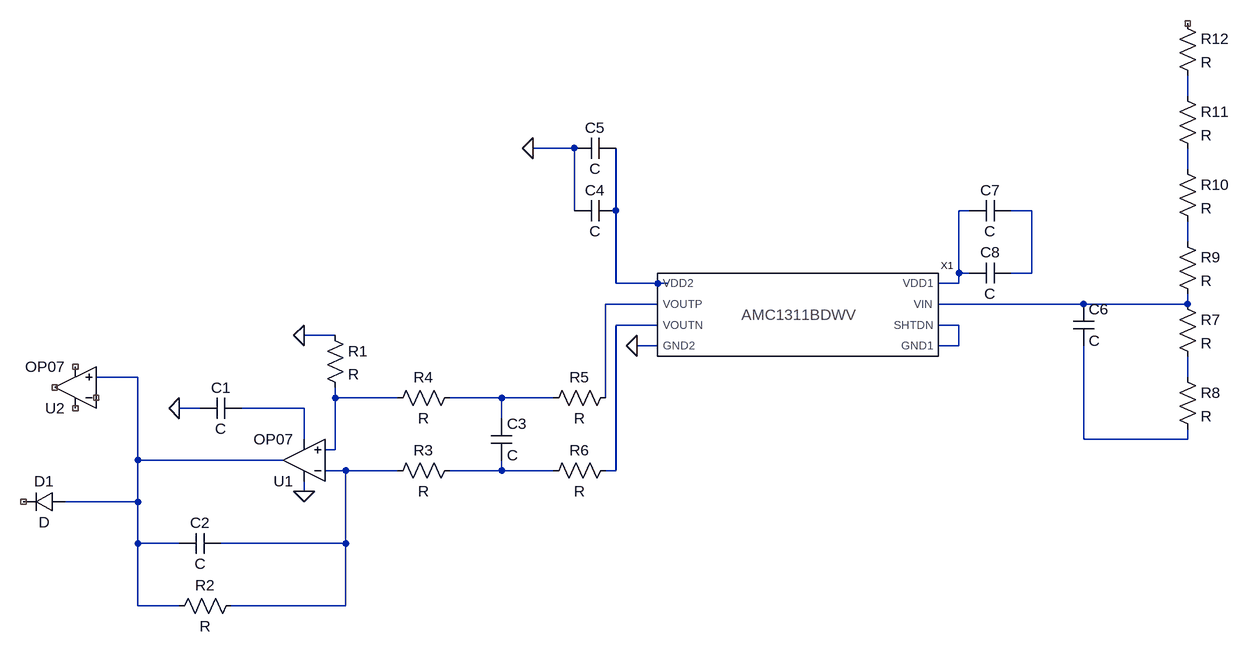
[diagram p0: schematic Bennet_LTSpice.asc]
Bennet_LTSpice.asc, the LTspice schematic file:
Version 4.1
SHEET 1 1588 680
WIRE 1488 -416 1488 -448
WIRE 544 -336 480 -336
WIRE 1488 -304 1488 -336
WIRE 544 -240 544 -336
WIRE 608 -240 608 -336
WIRE 1152 -240 1136 -240
WIRE 1248 -240 1216 -240
WIRE 1488 -192 1488 -224
WIRE 1136 -144 1136 -240
WIRE 1152 -144 1136 -144
WIRE 1248 -144 1248 -240
WIRE 1248 -144 1216 -144
WIRE 608 -128 608 -240
WIRE 672 -128 608 -128
WIRE 688 -128 672 -128
WIRE 1136 -128 1136 -144
WIRE 1136 -128 1104 -128
WIRE 672 -96 592 -96
WIRE 1328 -96 1104 -96
WIRE 1488 -96 1488 -112
WIRE 1488 -96 1328 -96
WIRE 672 -64 608 -64
WIRE 1136 -64 1104 -64
WIRE 176 -48 128 -48
WIRE 672 -32 640 -32
WIRE 1136 -32 1136 -64
WIRE 1136 -32 1104 -32
WIRE -128 16 -192 16
WIRE 1488 16 1488 -16
WIRE 176 48 176 32
WIRE 272 48 176 48
WIRE 432 48 352 48
WIRE 512 48 432 48
WIRE 592 48 592 -96
WIRE -32 64 -64 64
WIRE 128 64 32 64
WIRE 432 80 432 48
WIRE 128 112 128 64
WIRE 1328 112 1328 -32
WIRE 1488 112 1488 96
WIRE 1488 112 1328 112
WIRE 176 128 176 48
WIRE 176 128 160 128
WIRE -128 144 -128 16
WIRE 96 144 -128 144
WIRE 192 160 160 160
WIRE 272 160 192 160
WIRE 432 160 432 144
WIRE 432 160 352 160
WIRE 512 160 432 160
WIRE 608 160 608 -64
WIRE 608 160 592 160
WIRE 128 192 128 176
WIRE -128 208 -128 144
WIRE -128 208 -240 208
WIRE -128 272 -128 208
WIRE -64 272 -128 272
WIRE 192 272 192 160
WIRE 192 272 0 272
WIRE -128 368 -128 272
WIRE -64 368 -128 368
WIRE 192 368 192 272
WIRE 192 368 16 368
FLAG 128 -48 0
FLAG -64 64 0
FLAG 128 192 0
FLAG 480 -336 0
FLAG 640 -32 0
SYMBOL OpAmps\\OP07 128 208 R180
SYMATTR InstName U1
SYMBOL cap 32 48 R90
WINDOW 0 0 32 VBottom 2
WINDOW 3 32 32 VTop 2
SYMATTR InstName C1
SYMBOL OpAmps\\OP07 -224 96 R180
SYMATTR InstName U2
SYMBOL res 160 -64 R0
SYMATTR InstName R1
SYMBOL cap 0 256 R90
WINDOW 0 0 32 VBottom 2
WINDOW 3 32 32 VTop 2
SYMATTR InstName C2
SYMBOL res 32 352 R90
WINDOW 0 0 56 VBottom 2
WINDOW 3 32 56 VTop 2
SYMATTR InstName R2
SYMBOL res 368 144 R90
WINDOW 0 0 56 VBottom 2
WINDOW 3 32 56 VTop 2
SYMATTR InstName R3
SYMBOL diode -240 192 R90
WINDOW 0 0 32 VBottom 2
WINDOW 3 32 32 VTop 2
SYMATTR InstName D1
SYMBOL res 368 32 R90
WINDOW 0 0 56 VBottom 2
WINDOW 3 32 56 VTop 2
SYMATTR InstName R4
SYMBOL cap 416 80 R0
SYMATTR InstName C3
SYMBOL res 608 32 R90
WINDOW 0 0 56 VBottom 2
WINDOW 3 32 56 VTop 2
SYMATTR InstName R5
SYMBOL res 608 144 R90
WINDOW 0 0 56 VBottom 2
WINDOW 3 32 56 VTop 2
SYMATTR InstName R6
SYMBOL cap 608 -256 R90
WINDOW 0 0 32 VBottom 2
WINDOW 3 32 32 VTop 2
SYMATTR InstName C4
SYMBOL cap 608 -352 R90
WINDOW 0 0 32 VBottom 2
WINDOW 3 32 32 VTop 2
SYMATTR InstName C5
SYMBOL cap 1312 -96 R0
SYMATTR InstName C6
SYMBOL res 1472 -112 R0
SYMATTR InstName R7
SYMBOL res 1472 0 R0
SYMATTR InstName R8
SYMBOL res 1472 -208 R0
SYMATTR InstName R9
SYMBOL res 1472 -320 R0
SYMATTR InstName R10
SYMBOL res 1472 -432 R0
SYMATTR InstName R11
SYMBOL res 1472 -544 R0
SYMATTR InstName R12
SYMBOL AMC1311BDWV_CUSTOM 896 -80 R0
SYMATTR InstName X1
SYMBOL cap 1216 -256 R90
WINDOW 0 0 32 VBottom 2
WINDOW 3 32 32 VTop 2
SYMATTR InstName C7
SYMBOL cap 1216 -160 R90
WINDOW 0 0 32 VBottom 2
WINDOW 3 32 32 VTop 2
SYMATTR InstName C8

The netlist it stands for:
* Bennet_LTSpice.asc
X§U1 N013 N017 0 N015 N011 LT1001  ; OP07, pins In+ In- V+ V- OUT
C1 N015 0 C
X§U2 N011 NC_01 NC_02 NC_03 NC_04 LT1001  ; OP07, pins In+ In- V+ V- OUT
R1 0 N013 R
C2 N017 N011 C
R2 N017 N011 R
R3 N018 N017 R
D1 N011 NC_05 D
R4 N014 N013 R
C3 N014 N018 C
R5 N007 N014 R
R6 N009 N018 R
C4 N003 0 C
C5 N003 0 C
C6 N008 N016 C
R7 N008 N012 R
R8 N012 N016 R
R9 N006 N008 R
R10 N002 N006 R
R11 N001 N002 R
R12 NC_06 N001 R
X§X1 N003 N007 N009 0 N010 N010 N008 N004 AMC1311BDWV_CUSTOM  ; pins VDD2 VOUTP VOUTN GND2 GND1 SHTDN VIN VDD1
C7 N005 N004 C
C8 N005 N004 C
.model D D
.lib standard.dio
.lib LTC.lib
.backanno
.end